# Altium project AD8139.PrjPcb
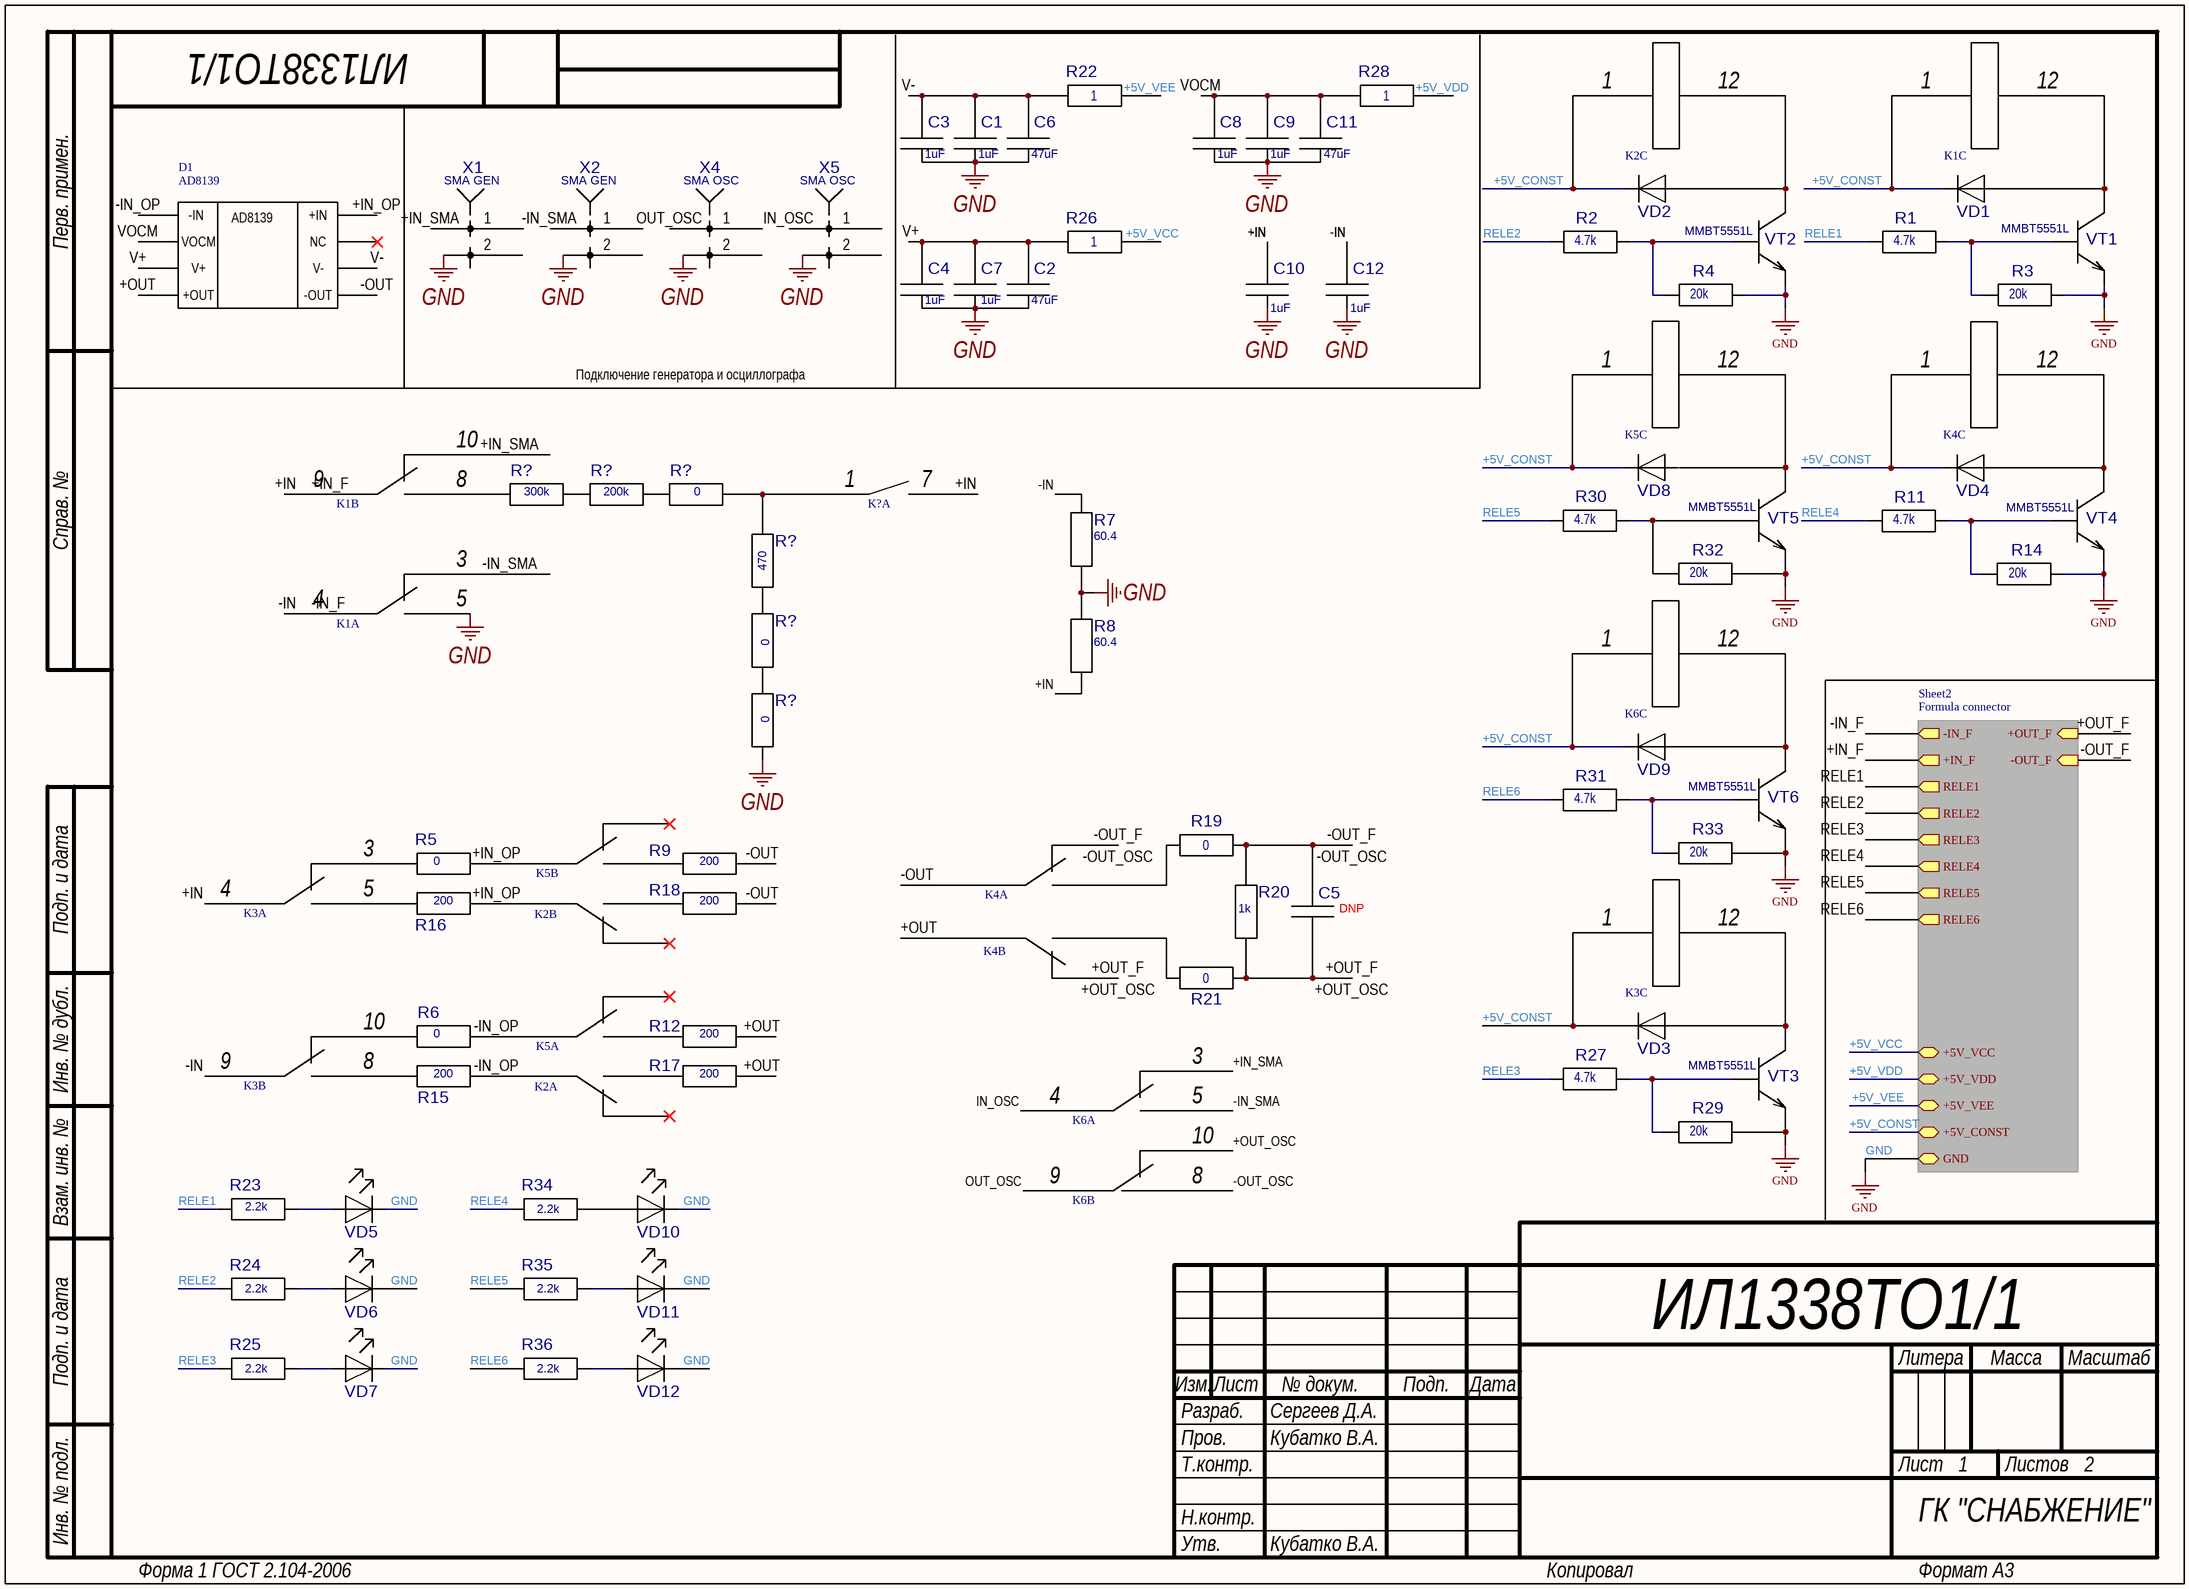
[diagram p0: Sheet1.SchDoc]
2 sheets, 83 parts. Net scope: hierarchical (ports join the sheet entries above them; power ports are global).
Board file: PCB1.PcbDoc
Sheets:
  Sheet1.SchDoc
    Formula connector = Sheet2.SchDoc

## Sheet Sheet1.SchDoc: AD8139
size 410 x 297 mm; ApprovedBy: Кубатко В.А.; CheckedBy: Кубатко В.А.; Author: Сергеев Д.А.; CompanyName: ГК "СНАБЖЕНИЕ"; DrawnBy: Сергеев Д.А.; Engineer: Сергеев Д.А.; Organization: ГК "СНАБЖЕНИЕ"; DocumentNumber: ИЛ1338ТО1/1; Revision: 1; SheetNumber: 1; SheetTotal: 2

### Parts
(Parts that share a designator on the sheet are numbered #1, #2 ... from top to bottom, then left to right.)
C1  1uF  [0805]
C2  47uF  [0805]
C3  1uF  [0805]
C4  1uF  [0805]
C5  DNP  [0805]
C6  47uF  [0805]
C7  1uF  [0805]
C8  1uF  [0805]
C9  1uF  [0805]
C10  1uF  [0805]
C11  47uF  [0805]
C12  1uF  [0805]
D1  AD8139  [AD8139]
K1  V23079A1001B301 TE  [V23079A1001B301]  (value not drawn)  (parts A,B,C of 3)
K2  V23079A1001B301 TE  [V23079A1001B301]  (value not drawn)  (parts A,B,C of 3)
K3  V23079A1001B301 TE  [V23079A1001B301]  (value not drawn)  (parts A,B,C of 3)
K4  V23079A1001B301 TE  [V23079A1001B301]  (value not drawn)  (parts A,B,C of 3)
K5  V23079A1001B301 TE  [V23079A1001B301]  (value not drawn)  (parts A,B,C of 3)
K6  V23079A1001B301 TE  [V23079A1001B301]  (value not drawn)  (parts A,B,C of 3)
K?  TRR1A05F00  [TRR1A05F00]  (value not drawn)  (part A of 2)
R1  4.7k  [0805]
R2  4.7k  [0805]
R3  20k  [0805]
R4  20k  [0805]
R5  0  [1206]
R6  0  [1206]
R7  60.4  [0805]
R8  60.4  [0805]
R9  200  [1206]
R11  4.7k  [0805]
R12  200  [1206]
R14  20k  [0805]
R15  200  [1206]
R16  200  [1206]
R17  200  [1206]
R18  200  [1206]
R19  0  [0805]
R20  1k  [0805]
R21  0  [0805]
R22  1  [0805]
R23  2.2k  [0805]
R24  2.2k  [0805]
R25  2.2k  [0805]
R26  1  [0805]
R27  4.7k  [0805]
R28  1  [0805]
R29  20k  [0805]
R30  4.7k  [0805]
R31  4.7k  [0805]
R32  20k  [0805]
R33  20k  [0805]
R34  2.2k  [0805]
R35  2.2k  [0805]
R36  2.2k  [0805]
R?#1  300k  [0805]
R?#2  200k  [0805]
R?#3  0  [0805]
R?#4  470  [0805]
R?#5  0  [0805]
R?#6  0  [0805]
VD1  LL4148 NXP  [SOD80C]  (value not drawn)
VD2  LL4148 NXP  [SOD80C]  (value not drawn)
VD3  LL4148 NXP  [SOD80C]  (value not drawn)
VD4  LL4148 NXP  [SOD80C]  (value not drawn)
VD5  LED(0805)  [0805(LED)]  (value not drawn)
VD6  LED(0805)  [0805(LED)]  (value not drawn)
VD7  LED(0805)  [0805(LED)]  (value not drawn)
VD8  LL4148 NXP  [SOD80C]  (value not drawn)
VD9  LL4148 NXP  [SOD80C]  (value not drawn)
VD10  LED(0805)  [0805(LED)]  (value not drawn)
VD11  LED(0805)  [0805(LED)]  (value not drawn)
VD12  LED(0805)  [0805(LED)]  (value not drawn)
VT1  MMBT5551L  [SOT-23]
VT2  MMBT5551L  [SOT-23]
VT3  MMBT5551L  [SOT-23]
VT4  MMBT5551L  [SOT-23]
VT5  MMBT5551L  [SOT-23]
VT6  MMBT5551L  [SOT-23]
X1  SMA GEN  [KLS1-SMA002-B]
X2  SMA GEN  [KLS1-SMA002-B]
X4  SMA OSC  [KLS1-SMA002-B]
X5  SMA OSC  [KLS1-SMA002-B]

### Sub-sheets
Formula connector = Sheet2: RELE1 (out), RELE2 (out), RELE3 (out), +5V_VCC (bidir), +5V_VEE (bidir), GND (bidir), +5V_CONST (bidir), +5V_VDD (bidir), +IN_F (out), -IN_F (out), +OUT_F (in), -OUT_F (in), RELE4 (out), RELE5 (out), RELE6 (out)

### Nets
GND: C1.2 C2.2 C3.2 C4.2 C6.2 C7.2 C8.2 C9.2 C10.2 C11.2 C12.2 K1.5 R3.2 R4.2 R7.1 R8.2 R14.2 R29.2 R32.2 R33.2 R?#6.1 VD5.2(K) VD6.2(K) VD7.2(K) VD10.2(K) VD11.2(K) VD12.2(K) VT1.2(E) VT2.2(E) VT3.2(E) VT4.2(E) VT5.2(E) VT6.2(E) X1.2 X2.2 X4.2 X5.2 ; sheet Formula connector/GND
+5V_CONST: K1.1 K2.1 K3.1 K4.1 K5.1 K6.1 VD1.2(K) VD2.2(K) VD3.2(K) VD4.2(K) VD8.2(K) VD9.2(K) ; sheet Formula connector/+5V_CONST
+5V_VCC: R26.2 ; sheet Formula connector/+5V_VCC
+5V_VDD: R28.2 ; sheet Formula connector/+5V_VDD
+5V_VEE: R22.2 ; sheet Formula connector/+5V_VEE
+IN: C10.1 C12.1 K1.4 K1.9 K3.4 K3.9 K?.7 R7.2 R8.1 ; sheet Formula connector/+IN_F, sheet Formula connector/-IN_F  [also labelled +IN_F, -IN, -IN_F]
+IN_OP: D1.8 K2.9 K5.9 R5.2 R16.2
+IN_SMA: K1.10 K6.3 X1.1
+OUT: D1.4 K4.9 R12.2 R17.2
+OUT_F: C5.1 K4.10 K6.10 R20.1 R21.2 ; sheet Formula connector/+OUT_F  [also labelled +OUT_OSC]
-IN_OP: D1.1 K2.4 K5.4 R6.2 R15.2
-IN_SMA: K1.3 K6.5 X2.1
-OUT: D1.5 K4.4 R9.2 R18.2
-OUT_F: C5.2 K4.3 K6.8 R19.2 R20.2 ; sheet Formula connector/-OUT_F  [also labelled -OUT_OSC]
IN_OSC: K6.4 X5.1
OUT_OSC: K6.9 X4.1
RELE1: R1.1 R23.1 ; sheet Formula connector/RELE1
RELE2: R2.1 R24.1 ; sheet Formula connector/RELE2
RELE3: R25.1 R27.1 ; sheet Formula connector/RELE3
RELE4: R11.1 R34.1 ; sheet Formula connector/RELE4
RELE5: R30.1 R35.1 ; sheet Formula connector/RELE5
RELE6: R31.1 R36.1 ; sheet Formula connector/RELE6
V+: C2.1 C4.1 C7.1 D1.3 R26.1
V-: C1.1 C3.1 C6.1 D1.6 R22.1
VOCM: C8.1 C9.1 C11.1 D1.2 R28.1
NetK1_8: K1.8 R?#1.1
NetK1_12: K1.12 VD1.1(A) VT1.3(K)
NetK2_5: K2.5 R17.1
NetK2_8: K2.8 R18.1
NetK2_12: K2.12 VD2.1(A) VT2.3(K)
NetK3_3: K3.3 R5.1
NetK3_5: K3.5 R16.1
NetK3_8: K3.8 R15.1
NetK3_10: K3.10 R6.1
NetK3_12: K3.12 VD3.1(A) VT3.3(K)
NetK4_5: K4.5 R19.1
NetK4_8: K4.8 R21.1
NetK4_12: K4.12 VD4.1(A) VT4.3(K)
NetK5_5: K5.5 R12.1
NetK5_8: K5.8 R9.1
NetK5_12: K5.12 VT5.3(K)
NetK6_12: K6.12 VD9.1(A) VT6.3(K)
NetK?_1: K?.1 R?#3.2 R?#4.2
NetR1_2: R1.2 R3.1 VT1.1(B)
NetR2_2: R2.2 R4.1 VT2.1(B)
NetR11_2: R11.2 R14.1 VT4.1(B)
NetR23_2: R23.2 VD5.1(A)
NetR24_2: R24.2 VD6.1(A)
NetR25_2: R25.2 VD7.1(A)
NetR27_2: R27.2 R29.1 VT3.1(B)
NetR30_2: R30.2 R32.1 VT5.1(B)
NetR31_2: R31.2 R33.1 VT6.1(B)
NetR34_2: R34.2 VD10.1(A)
NetR35_2: R35.2 VD11.1(A)
NetR36_2: R36.2 VD12.1(A)
NetR?#1_2: R?#1.2 R?#2.1
NetR?#2_2: R?#2.2 R?#3.1
NetR?#4_1: R?#4.1 R?#5.2
NetR?#5_1: R?#5.1 R?#6.2

Not connected (* = marked no-connect by the designer): D1 7*; K2 3* 10*; K5 3* 10*; VD8 1(A)

### Notes on the sheet
- Подключение генератора и осциллографа
- Перв. примен.
- Справ. №
- Подп. и дата
- Инв. № дубл.
- Взам. инв. №
- Разраб.
- Изм.
- Лист
- № докум.
- Подп.
- Дата
- Литера
- Масса
- Масштаб
- Пров.
- Т.контр.
- Листов
- Инв. № подл.
- Н.контр.
- Утв.
- Форма 1 ГОСТ 2.104-2006
- Копировал
- Формат А3

### Library data of the parts
C1-C12 = C0805: ComponentHeigt: 1.3; Firme: AVX; Leadform: SMD; KIND: Конденсатор; ClassName: *; Component Link: *; ComponentWeigt: *; Packaging: 0805; NN: *
R1-R4 R7 R8 R11 R14 R19-R36 = R0805 Yageo: ComponentHeigt: 0.6; Firme: Yageo; Leadform: SMD; Kind: Резистор; ClassName: *; ComponentWeigt: *; Component Link: *; Packaging: 0805; NN: *
  R1 R2 R11 R27 R30 R31: Value: 4.7k
  R3 R4 R14 R29 R32 R33: Value: 20k
  R19 R21: Value: 0
  R22 R26 R28: Value: 1
R5 R6 R9 R12 R15-R18 = R1206 Yageo: ComponentHeigt: 0.6; Firme: Yageo; Leadform: SMD; Kind: Резистор; ClassName: *; ComponentWeigt: *; Component Link: *; Packaging: 0805; NN: *
  R15: Value: 200
R?#1-R?#6 = R0805 Yageo: ComponentHeigt: 0.6; Leadform: SMD; Kind: Резистор; ClassName: *; ComponentWeigt: *; Component Link: *; Firme: Yageo; Packaging: 0805; NN: *; Value: *
VD1-VD4 VD8 VD9 = LL4148 NXP: ComponentHeigt: 1.6; Leadform: SMD; NN: 24009301; KIND: Диод LL4148 NXP; Component Link: http://www.nxp.com; Packaging: SOD-80C; ClassName: *; Firme: NXP
VD5-VD7 VD10-VD12 = LED(0805): ComponentHeigt: 0.75; Leadform: в отверстия; Firme: Kingbright; NN: 24003000; KIND: Светодиод L-1154GD Kingbright; Component Link: *; ClassName: *
VT1-VT6 = MMBT5551L: ComponentHeigt: 1.1; Firme: ONS; Leadform: SMD; NN: 24007468; KIND: Транзистор MMBT5551L*G ONS; ClassName: *; ComponentWeigt: *; Packaging: SOT-23
X1 X2 X4 X5 = KLS1-SMA002-B: ComponentHeigt: 5.5; Name: Вилка; Specification: Вилка PLD2-2 *; Typ: PLD2-2; ClassName: *; Component Link: *; ComponentWeigt: *; Firme: *; Leadform: *; NN: *; KIND: *

## Sheet Sheet2.SchDoc: AD8139
size 410 x 297 mm; ApprovedBy: Кубатко В.А.; CheckedBy: Кубатко В.А.; Author: Сергеев Д.А.; CompanyName: ГК "СНАБЖЕНИЕ"; DrawnBy: Сергеев Д.А.; Engineer: Сергеев Д.А.; Organization: ГК "СНАБЖЕНИЕ"; DocumentNumber: ИЛ1338ТО1/1; Revision: 1; SheetNumber: 2; SheetTotal: 2
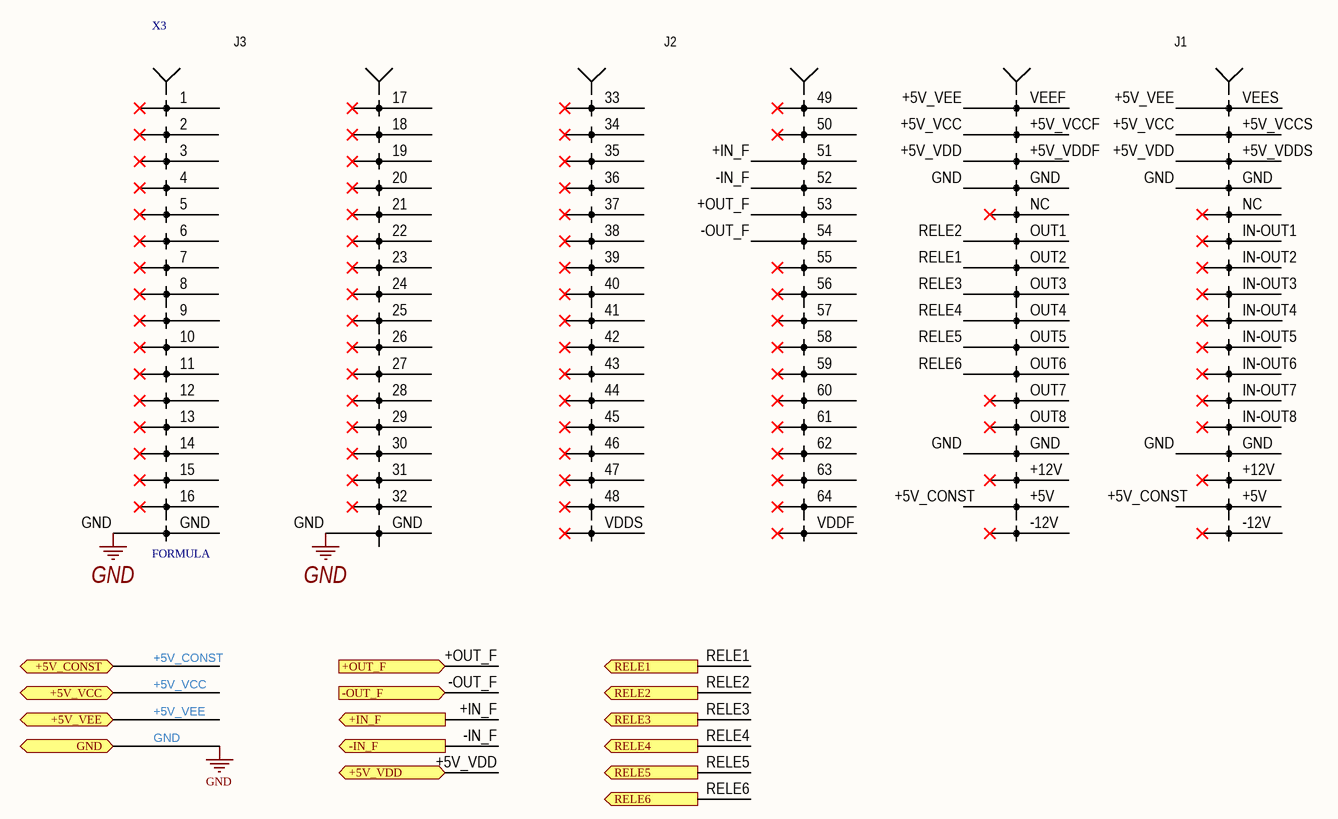
[diagram p1: Sheet2.SchDoc]

### Parts
X3  FORMULA  [FORMULA]

### Ports
+5V_CONST (bidir), +5V_VCC (bidir), +5V_VDD (bidir), +5V_VEE (bidir), +IN_F (out), +OUT_F (in), -IN_F (out), -OUT_F (in), GND (bidir), RELE1 (out), RELE2 (out), RELE3 (out), RELE4 (out), RELE5 (out), RELE6 (out)

### Nets
GND: X3.GND ; port GND
+5V_CONST: X3.+5V ; port +5V_CONST
+5V_VCC: X3.+5V_VCCF(VCCF) X3.+5V_VCCS(VCCS) ; port +5V_VCC
+5V_VDD: X3.+5V_VDDF(VDDF) X3.+5V_VDDS(VDDS) ; port +5V_VDD
+5V_VEE: X3.VEEF X3.VEES ; port +5V_VEE
+IN_F: X3.51 X3.52 ; port +IN_F, port -IN_F  [also labelled -IN_F]  [project net +IN]
+OUT_F: X3.53 ; port +OUT_F
-OUT_F: X3.54 ; port -OUT_F
RELE1: X3.OUT2 ; port RELE1
RELE2: X3.OUT1 ; port RELE2
RELE3: X3.OUT3 ; port RELE3
RELE4: X3.OUT4 ; port RELE4
RELE5: X3.OUT5 ; port RELE5
RELE6: X3.OUT6 ; port RELE6

Not connected (* = marked no-connect by the designer): X3 1* 2* 3* 4* 5* 6* 7* 8* 9* 10* 11* 12* 13* 14* 15* 16* 17* 18* 19* 20* 21* 22* 23* 24* 25* 26* 27* 28* 29* 30* 31* 32* 33* 34* 35* 36(4)* 37(5)* 38* 39* 40* 41* 42* 43* 44* 45* 46* 47* 48* 49* 50* 55* 56* 57* 58* 59* 60* 61* 62* 63* 64* +12V* -12V* IN-OUT1* IN-OUT2* IN-OUT3* IN-OUT4* IN-OUT5* IN-OUT6* IN-OUT7* IN-OUT8* NC* OUT7* OUT8* VDDF* VDDS*

### Notes on the sheet
- Перв. примен.
- Справ. №
- Подп. и дата
- Инв. № дубл.
- Взам. инв. №
- Разраб.
- Изм.
- Лист
- № докум.
- Подп.
- Дата
- Литера
- Масса
- Масштаб
- Пров.
- Т.контр.
- Листов
- Инв. № подл.
- Н.контр.
- Утв.
- Форма 1 ГОСТ 2.104-2006
- Копировал
- Формат А3

## Nets that join several sheets
GND: Sheet1 (37 pins), Sheet2 (X3.GND)
+5V_CONST: Sheet1 (12 pins), Sheet2 (X3.+5V)
+5V_VCC: Sheet1 (R26.2), Sheet2 (X3.+5V_VCCF X3.+5V_VCCS)
+5V_VDD: Sheet1 (R28.2), Sheet2 (X3.+5V_VDDF X3.+5V_VDDS)
+5V_VEE: Sheet1 (R22.2), Sheet2 (X3.VEEF X3.VEES)
+IN: Sheet1 (9 pins), Sheet2 (X3.51 X3.52)
+OUT_F: Sheet1 (5 pins), Sheet2 (X3.53)
-OUT_F: Sheet1 (5 pins), Sheet2 (X3.54)
RELE1: Sheet1 (R1.1 R23.1), Sheet2 (X3.OUT2)
RELE2: Sheet1 (R2.1 R24.1), Sheet2 (X3.OUT1)
RELE3: Sheet1 (R25.1 R27.1), Sheet2 (X3.OUT3)
RELE4: Sheet1 (R11.1 R34.1), Sheet2 (X3.OUT4)
RELE5: Sheet1 (R30.1 R35.1), Sheet2 (X3.OUT5)
RELE6: Sheet1 (R31.1 R36.1), Sheet2 (X3.OUT6)